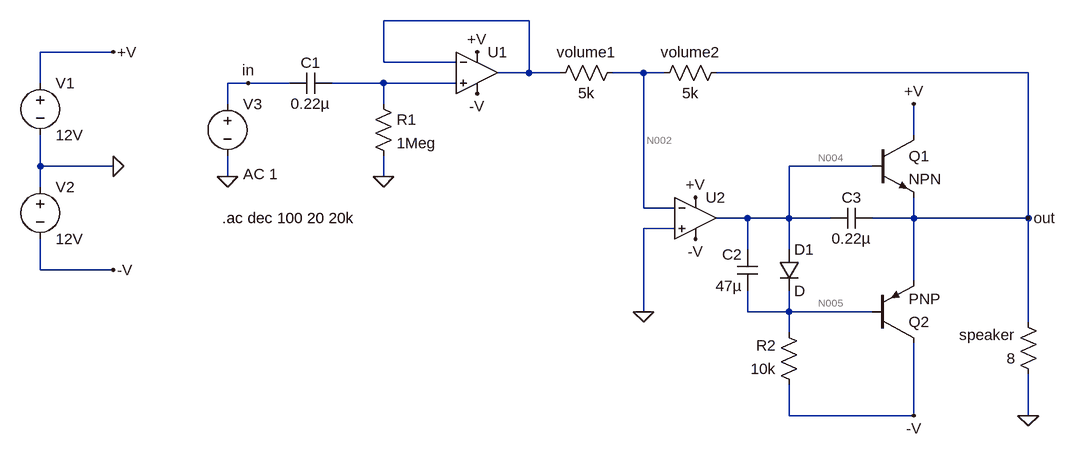
[diagram p0: schematic 01_original.asc]
01_original.asc, the LTspice schematic file:
Version 4.1
SHEET 1 1876 680
WIRE 768 16 544 16
WIRE 128 64 16 64
WIRE 544 80 544 16
WIRE 656 80 544 80
WIRE 768 96 768 16
WIRE 768 96 720 96
WIRE 816 96 768 96
WIRE 944 96 896 96
WIRE 976 96 944 96
WIRE 1536 96 1056 96
WIRE 16 112 16 64
WIRE 336 112 304 112
WIRE 400 112 336 112
WIRE 544 112 464 112
WIRE 656 112 544 112
WIRE 304 144 304 112
WIRE 544 144 544 112
WIRE 1360 192 1360 144
WIRE 16 240 16 192
WIRE 128 240 16 240
WIRE 1296 240 1168 240
WIRE 304 256 304 224
WIRE 544 256 544 224
WIRE 16 272 16 240
WIRE 944 304 944 96
WIRE 992 304 944 304
WIRE 1104 320 1056 320
WIRE 1168 320 1168 240
WIRE 1168 320 1104 320
WIRE 1232 320 1168 320
WIRE 1360 320 1360 288
WIRE 1360 320 1296 320
WIRE 1536 320 1536 96
WIRE 1536 320 1360 320
WIRE 992 336 944 336
WIRE 1104 368 1104 320
WIRE 1168 368 1168 320
WIRE 16 400 16 352
WIRE 128 400 16 400
WIRE 1360 416 1360 320
WIRE 944 464 944 336
WIRE 1104 464 1104 432
WIRE 1168 464 1168 432
WIRE 1168 464 1104 464
WIRE 1296 464 1168 464
WIRE 1536 480 1536 320
WIRE 1168 496 1168 464
WIRE 1168 624 1168 576
WIRE 1360 624 1360 512
WIRE 1360 624 1168 624
WIRE 1536 624 1536 560
FLAG 128 64 +V
FLAG 128 400 -V
FLAG 128 240 0
FLAG 336 112 in
FLAG 544 256 0
FLAG 688 128 -V
FLAG 688 64 +V
FLAG 1024 352 -V
FLAG 1024 288 +V
FLAG 1536 624 0
FLAG 944 464 0
FLAG 1360 144 +V
FLAG 1360 624 -V
FLAG 304 256 0
FLAG 1536 320 out
SYMBOL voltage 16 96 R0
WINDOW 123 0 0 Left 0
WINDOW 39 0 0 Left 0
SYMATTR InstName V1
SYMATTR Value 12V
SYMBOL voltage 16 256 R0
WINDOW 123 0 0 Left 0
WINDOW 39 0 0 Left 0
SYMATTR InstName V2
SYMATTR Value 12V
SYMBOL res 528 128 R0
SYMATTR InstName R1
SYMATTR Value 1Meg
SYMBOL res 912 80 R90
WINDOW 0 0 56 VBottom 2
WINDOW 3 32 56 VTop 2
SYMATTR InstName volume1
SYMATTR Value 5k
SYMBOL cap 464 96 R90
WINDOW 0 0 32 VBottom 2
WINDOW 3 32 32 VTop 2
SYMATTR InstName C1
SYMATTR Value 0.22µ
SYMBOL cap 1120 432 R180
WINDOW 0 24 56 Left 2
WINDOW 3 24 8 Left 2
SYMATTR InstName C2
SYMATTR Value 47µ
SYMBOL cap 1296 304 R90
WINDOW 0 0 32 VBottom 2
WINDOW 3 32 32 VTop 2
SYMATTR InstName C3
SYMATTR Value 0.22µ
SYMBOL OpAmps\\UniversalOpAmp2 688 96 R0
SYMATTR InstName U1
SYMBOL OpAmps\\UniversalOpAmp2 1024 320 R0
SYMATTR InstName U2
SYMBOL res 1552 576 R180
WINDOW 0 36 76 Left 2
WINDOW 3 36 40 Left 2
SYMATTR InstName speaker
SYMATTR Value 8
SYMBOL res 1184 592 R180
WINDOW 0 36 76 Left 2
WINDOW 3 36 40 Left 2
SYMATTR InstName R2
SYMATTR Value 10k
SYMBOL diode 1152 368 R0
SYMATTR InstName D1
SYMBOL npn 1296 192 R0
SYMATTR InstName Q1
SYMBOL pnp 1296 512 M180
SYMATTR InstName Q2
SYMBOL voltage 304 128 R0
WINDOW 3 24 96 Invisible 2
WINDOW 123 24 124 Left 2
WINDOW 39 0 0 Left 0
SYMATTR Value 12V
SYMATTR Value2 AC 1
SYMATTR InstName V3
SYMBOL res 1072 80 R90
WINDOW 0 0 56 VBottom 2
WINDOW 3 32 56 VTop 2
SYMATTR InstName volume2
SYMATTR Value 5k
TEXT 296 320 Left 2 !.ac dec 100 20 20k

The netlist it stands for:
* 01_original.asc
V1 +V 0 12V
V2 0 -V 12V
R1 N003 0 1Meg
R§volume1 N002 N001 5k
C1 N003 in 0.22µ
C2 N005 N004 47µ
C3 out N004 0.22µ
X§U1 N003 N001 +V -V N001 level2 Avol=1Meg GBW=10Meg Slew=10Meg Ilimit=25m Rail=0 Vos=0 En=0 Enk=0 In=0 Ink=0 Rin=500Meg  ; pins In+ In- V+ V- OUT
X§U2 0 N002 +V -V N004 level2 Avol=1Meg GBW=10Meg Slew=10Meg Ilimit=25m Rail=0 Vos=0 En=0 Enk=0 In=0 Ink=0 Rin=500Meg  ; pins In+ In- V+ V- OUT
R§speaker 0 out 8
R2 -V N005 10k
D1 N004 N005 D
Q1 +V N004 out 0 NPN
Q2 -V N005 out 0 PNP
V3 in 0 12V AC 1
R§volume2 out N002 5k
.model D D
.lib standard.dio
.model NPN NPN
.model PNP PNP
.lib standard.bjt
.ac dec 100 20 20k
.lib UniversalOpAmp2.lib
.backanno
.end

* Results of the author's LTspice run, read from the files saved beside the schematic
* Operating Point, zero values left out:
*   V(+v) = 12 V
*   V(-v) = -12 V
*   V(in) = 12 V
*   V(n002) = -157.9 nV
*   V(n004) = 147 mV
*   V(n005) = -511.7 mV
*   V(out) = -315.7 nV
*   I(D1) = 1.149 mA
*   I(R2) = -1.149 mA
*   I(V1) = -3.103 mA
*   I(V2) = -3.103 mA
*   I(speaker) = 39.47 nA
*   I(volume1) = -31.57 pA
*   I(volume2) = -31.57 pA
*   Ib(Q1) = -11.71 pA
*   Ib(Q2) = -380.1 pA
*   Ic(Q1) = 11.88 pA
*   Ic(Q2) = -39.12 nA
*   Ie(Q2) = 39.5 nA
*   Ix(u1:3) = 1.199 mA
*   Ix(u1:4) = -1.199 mA
*   Ix(u1:5) = -31.57 pA
*   Ix(u2:3) = 1.904 mA
*   Ix(u2:4) = -754.8 µA
*   Ix(u2:5) = -1.149 mA
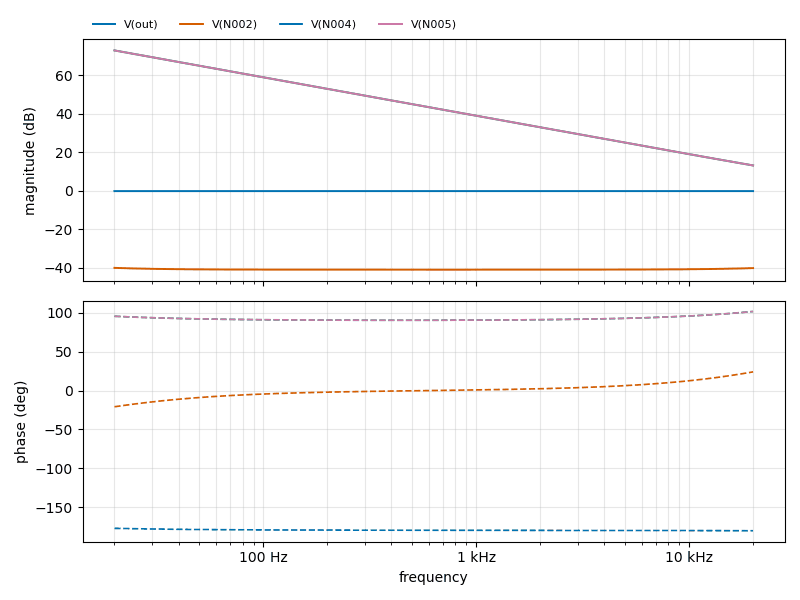
[diagram p1: AC Analysis of 01_original.asc, plotted from the saved traces]
* AC Analysis, 1 run:
*   V(out): -0.17 dB at 20 Hz, -0.16 dB at 20 kHz, peak -0.16 dB at 1.483 kHz
*   V(N002): -40.05 dB at 20 Hz, -40.16 dB at 20 kHz, peak -40.05 dB at 20 Hz
*   V(N004): 72.94 dB at 20 Hz, 13.17 dB at 20 kHz, peak 72.94 dB at 20 Hz, 3 dB below the peak at 28.32 Hz
*   V(N005): 72.92 dB at 20 Hz, 13.17 dB at 20 kHz, peak 72.92 dB at 20 Hz, 3 dB below the peak at 28.32 Hz